# Altium schematic sheet ORing.SchDoc
size A; SheetNumber: 3; SheetTotal: 5
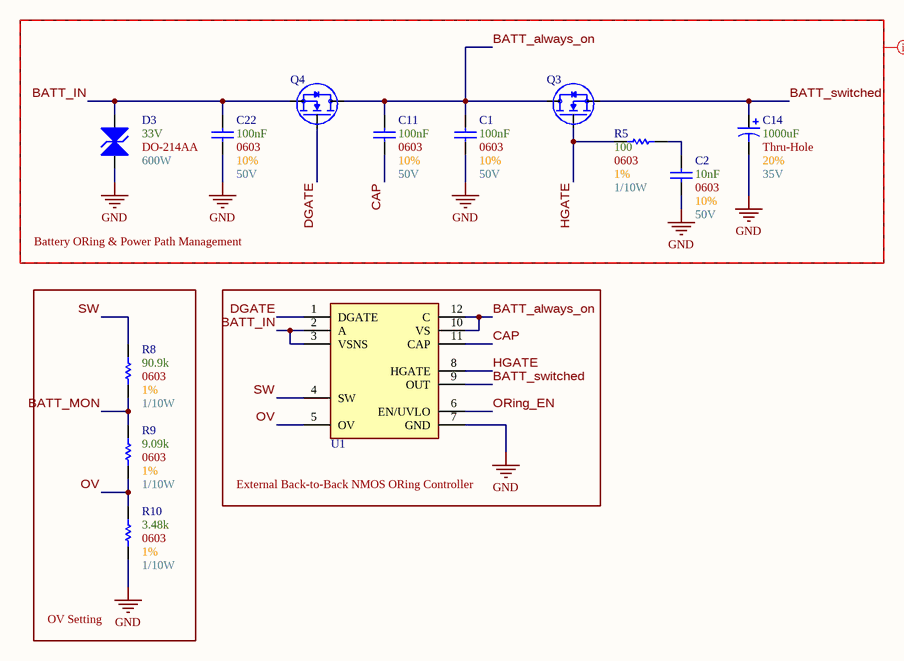
[diagram p0: ORing.SchDoc]

## Parts
C1  Max Voltage: 50V  Size Package: 0603  Tolerance: 10%  Capacitance: 100nF  [[Cap] SMD 0603]  (hidden comment: [Cap] 0603 0.1uF 10% 50V)
C2  Max Voltage: 50V  Size Package: 0603  Tolerance: 10%  Capacitance: 10nF  [[Cap] SMD 0603]  (hidden comment: [Cap] 0603 0.01uF 10% 50V)
C11  Max Voltage: 50V  Size Package: 0603  Tolerance: 10%  Capacitance: 100nF  [[Cap] SMD 0603]  (hidden comment: [Cap] 0603 0.1uF 10% 50V)
C14  Max Voltage: 35V  Size Package: Thru-Hole  Tolerance: 20%  Capacitance: 1000uF  [[Cap] Thru-Hole Polarized 10mm]  (hidden comment: [Cap] Thru-Hole 1000uF 20% 35V)
C22  Max Voltage: 50V  Size Package: 0603  Tolerance: 10%  Capacitance: 100nF  [[Cap] SMD 0603]  (hidden comment: [Cap] 0603 0.1uF 10% 50V)
D3  Wattage: 600W  Optimal Zener Voltage: 33V  [[Diode] SMD DO-214AA]  (hidden comment: DO-214AA)
Q3  [NMOS] SMD 40V 175A 0.55mOhm  [[NMOS] SMD 40V 175A 0.55mOhm]  (value not drawn)
Q4  [NMOS] SMD 40V 175A 0.55mOhm  [[NMOS] SMD 40V 175A 0.55mOhm]  (value not drawn)
R5  Wattage: 1/10W  Tolerance: 1%  Resistance: 100  Size Package: 0603  [[Res] SMD 0603]  (hidden comment: [100] SMD 0603 1% 1/10W)
R8  Wattage: 1/10W  Tolerance: 1%  Resistance: 90.9k  Size Package: 0603  [[Res] SMD 0603]  (hidden comment: [90.9k] SMD 0603 1% 1/10W)
R9  Wattage: 1/10W  Tolerance: 1%  Resistance: 9.09k  Size Package: 0603  [[Res] SMD 0603]  (hidden comment: [9.09k] SMD 0603 1% 1/10W)
R10  Wattage: 1/10W  Tolerance: 1%  Resistance: 3.48k  Size Package: 0603  [[Res] SMD 0603]  (hidden comment: [3.48k] SMD 0603 1% 1/10W_1)
U1  [ORing] Back-to-Back External NMOS Controller  [[ORing] Back-to-Back External NMOS Controller]  (value not drawn)

## Blocks framed on the sheet
Battery ORing & Power Path Management: C1 C2 C11 C14 C22 D3 Q3 Q4 R5
OV Setting: R8-R10
External Back-to-Back NMOS ORing Controller: U1

## Nets
GND: C1.1 C2.1 C14.2 C22.1 D3.1(A) R10.2 U1.7(GND)
BATT_always_on: C1.2 C11.2 Q3.3(Drain) Q4.3(Drain) U1.10(VS) U1.12(C)
BATT_IN: C22.2 D3.2(K) Q4.1(Source) U1.2(A) U1.3(VSNS)
BATT_MON: R8.1 R9.2
BATT_switched: C14.1 Q3.1(Source) U1.9(OUT)
CAP: C11.1 U1.11(CAP)
DGATE: Q4.2(Gate) U1.1(DGATE)
HGATE: Q3.2(Gate) R5.1 U1.8(HGATE)
ORing_EN: U1.6(EN/UVLO)
OV: R9.1 R10.1 U1.5(OV)
SW: R8.2 U1.4(SW)
NetC2_2: C2.2 R5.2

## Layout directives
net class High_Current_Nets: BATT_always_on, BATT_IN, BATT_switched, CAP, DGATE, GND, HGATE

## Library data of the parts
C1 C11 C22 = [Cap] 0603 0.1uF 10% 50V: CL10B104KB8NNNC; Supplier 1: DigiKey; Supplier Part Number 1: 1276-1000-6-ND
C2 = [Cap] 0603 0.01uF 10% 50V: C0603C103K5RACTU; Supplier 1: DigiKey; Supplier Part Number 1: 399-C0603C103K5RACTUDKR-ND
C14 = [Cap] Thru-Hole 1000uF 20% 35V: 35PK1000MEFC10X20; Supplier 1: DigiKey; Supplier Part Number 1: 1189-1742-ND
D3 = [TVS] SMBJ33CA: SMBJ33CA; Supplier 1: DigiKey; Supplier Part Number 1: SMBJ33CA-FDICT-ND; Footprint: DO-214AA
Q3 Q4 = [NMOS] SMD 40V 175A 0.55mOhm: IAUCN04S7N005ATMA1; Supplier 1: DigiKey; Supplier Part Number 1: 448-IAUCN04S7N005ATMA1CT-ND
R5 = [100] SMD 0603 1% 1/10W: RC0603FR-07100RL; Supplier 1: DigiKey; Supplier Part Number 1: 311-100HRDKR-ND
R8 = [90.9k] SMD 0603 1% 1/10W: CR0603-FX-9092ELF; Supplier 1: DigiKey; Supplier Part Number 1: CR0603-FX-9092ELFCT-ND
R9 = [9.09k] SMD 0603 1% 1/10W: RMCF0603FT9K09; Supplier 1: DigiKey; Supplier Part Number 1: RMCF0603FT9K09CT-ND
R10 = [3.48k] SMD 0603 1% 1/10W_1: RMCF0603FT3K48; Supplier 1: DigiKey; Supplier Part Number 1: RMCF0603FT3K48CT-ND
U1 = [ORing] Back-to-Back External NMOS Controller: LM74810QDRRRQ1; Supplier 1: DigiKey; Supplier Part Number 1: 296-LM74810QDRRRQ1CT-ND